# Altium schematic sheet Ports_and_pins.SchDoc
size A4; SheetNumber: 4; SheetTotal: 4
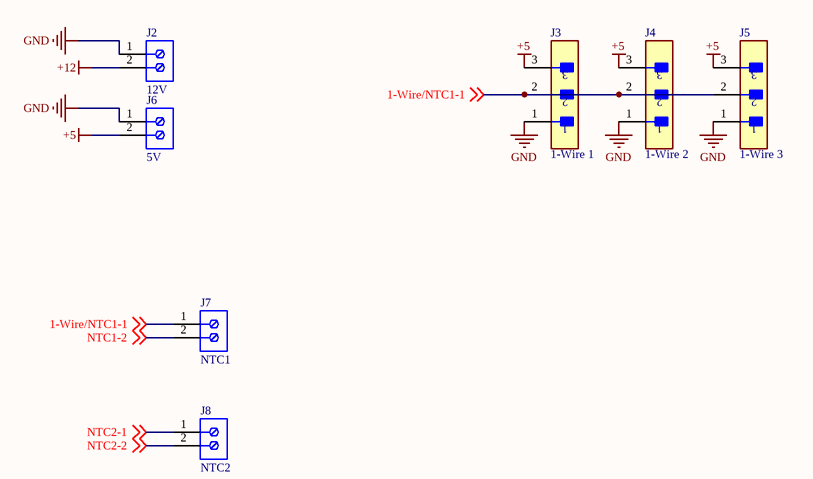
[diagram p0: Ports_and_pins.SchDoc]

## Parts
J2  12V  [691214110002]
J3  1-Wire 1  [FP-MTLW-103-07-G-S-230-MFG]
J4  1-Wire 2  [FP-MTLW-103-07-G-S-230-MFG]
J5  1-Wire 3  [FP-MTLW-103-07-G-S-230-MFG]
J6  5V  [691214110002]
J7  NTC1  [691214110002]
J8  NTC2  [691214110002]

## Nets
+5: J3.3 J4.3 J5.3 J6.2
+12: J2.2
GND: J2.1 J3.1 J4.1 J5.1 J6.1
1-Wire/NTC1-1: J3.2 J4.2 J5.2 J7.1 ; off-sheet 1-Wire/NTC1-1
NTC1-2: J7.2 ; off-sheet NTC1-2
NTC2-1: J8.1 ; off-sheet NTC2-1
NTC2-2: J8.2 ; off-sheet NTC2-2

## Library data of the parts
J2 J6-J8 = CMP-1502-02464-3: 2141 Series 3.5MM Pitch Straight, Pcb Terminal Block, Through Hole, 2 Way; Plating: Brass, Steel; Wire Gauge (Min): 16AWG; Number of Contacts: 2; Current: 10A; Stripping Length: -6mm; Voltage Rating: 300V; Pitch: 3.5052mm; Wire Gauge (Max): 24AWG; Number of Levels: 1; Lead Pitch: 3.5mm; Width: 7.9mm; Packaging: Box; RoHS: Compliant; Number of Rows: 1; Min Operating Temperature: -40°C; Mount: Through Hole; Number of Pins: 2; Contact Plating: Brass, Tin; Housing Material: Nylon; Current Rating: 10A; Termination: Screw; Color: Blue, Green; Number of Positions Per Level: 2; Height: 8.7mm; Voltage: 300V; Max Operating Temperature: 105°C; Wire/Cable Gauge: 24AWG; Length: 7.4mm; Contact Material: Tin
J3-J5 = CMP-02766-001679-1: CONN HEADER VERT 3POS 2.54MM; Max Current Rating: 3A; Number of Contacts: 3; Gender: Male; Contact Material: Bronze; Pitch: 2.54mm; Housing Material: Polymer; Contact Plating: Gold; Radiation Hardening: No; Depth: 2.48mm; Packaging: Bulk; Number of Rows: 1; Max Operating Temperature: 125°C; Housing Color: Black; Termination: Solder; Min Operating Temperature: -55°C; Length: 7.62mm; RoHS Compliant: Yes; Orientation: Straight